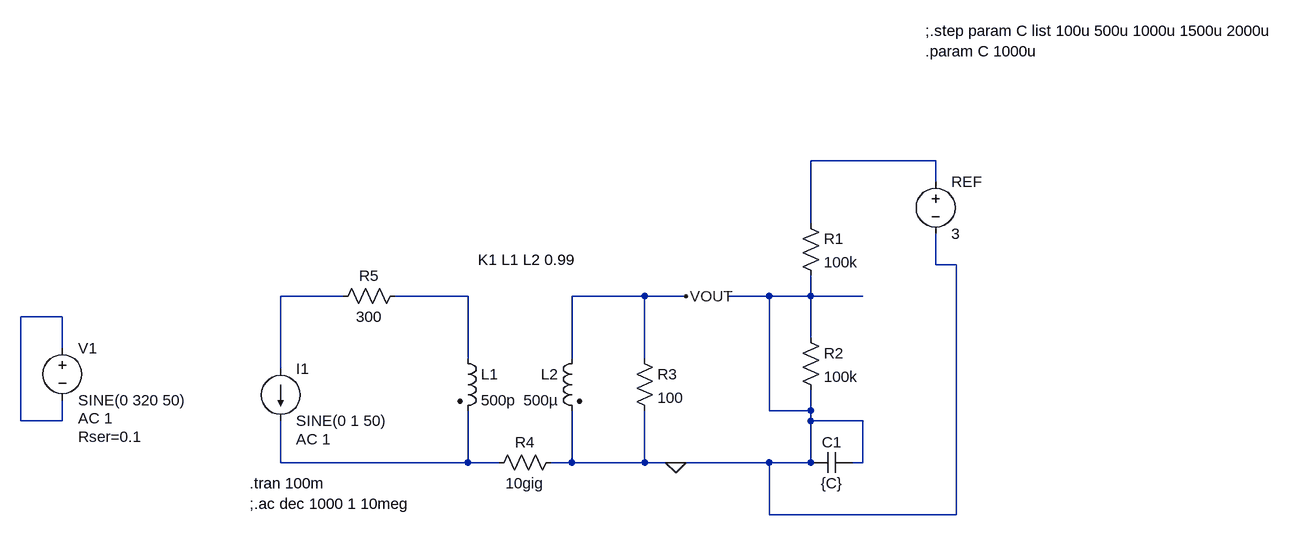
[diagram p0: schematic mains_measure_current.asc]
mains_measure_current.asc, the LTspice schematic file:
Version 4
SHEET 1 1512 680
WIRE 976 -176 784 -176
WIRE 976 -144 976 -176
WIRE 784 -80 784 -176
WIRE 976 -16 976 -64
WIRE 1008 -16 976 -16
WIRE 64 32 -32 32
WIRE 256 32 144 32
WIRE 528 32 416 32
WIRE 592 32 528 32
WIRE 720 32 656 32
WIRE 784 32 784 0
WIRE 784 32 720 32
WIRE 864 32 784 32
WIRE -368 64 -432 64
WIRE 784 96 784 32
WIRE -368 112 -368 64
WIRE 256 128 256 32
WIRE 416 128 416 32
WIRE 528 128 528 32
WIRE -32 144 -32 32
WIRE 720 208 720 32
WIRE 784 208 784 176
WIRE 784 208 720 208
WIRE -432 224 -432 64
WIRE -368 224 -368 192
WIRE -368 224 -432 224
WIRE 784 224 784 208
WIRE 864 224 784 224
WIRE -32 288 -32 224
WIRE 256 288 256 208
WIRE 256 288 -32 288
WIRE 304 288 256 288
WIRE 416 288 416 208
WIRE 416 288 384 288
WIRE 528 288 528 208
WIRE 528 288 416 288
WIRE 576 288 528 288
WIRE 720 288 576 288
WIRE 784 288 784 224
WIRE 784 288 720 288
WIRE 864 288 864 224
WIRE 864 288 848 288
WIRE 720 368 720 288
WIRE 1008 368 1008 -16
WIRE 1008 368 720 368
FLAG 576 288 0
FLAG 592 32 VOUT
SYMBOL voltage 976 -160 R0
WINDOW 123 0 0 Left 0
WINDOW 39 0 0 Left 0
SYMATTR InstName REF
SYMATTR Value 3
SYMBOL res 512 112 R0
SYMATTR InstName R3
SYMATTR Value 100
SYMBOL ind2 240 112 R0
SYMATTR InstName L1
SYMATTR Value 500p
SYMATTR Type ind
SYMATTR SpiceLine Rser=1p
SYMBOL current -32 144 R0
WINDOW 123 24 108 Left 2
WINDOW 39 0 0 Left 0
SYMATTR InstName I1
SYMATTR Value SINE(0 1 50)
SYMATTR Value2 AC 1
SYMBOL ind2 432 112 M0
SYMATTR InstName L2
SYMATTR Value 500µ
SYMATTR Type ind
SYMATTR SpiceLine Rser=1m
SYMBOL res 768 -96 R0
SYMATTR InstName R1
SYMATTR Value 100k
SYMBOL res 768 80 R0
SYMATTR InstName R2
SYMATTR Value 100k
SYMBOL cap 848 272 R90
WINDOW 0 0 32 VBottom 2
WINDOW 3 32 32 VTop 2
SYMATTR InstName C1
SYMATTR Value {C}
SYMBOL res 400 272 R90
WINDOW 0 0 56 VBottom 2
WINDOW 3 32 56 VTop 2
SYMATTR InstName R4
SYMATTR Value 10gig
SYMBOL res 160 16 R90
WINDOW 0 0 56 VBottom 2
WINDOW 3 32 56 VTop 2
SYMATTR InstName R5
SYMATTR Value 300
SYMBOL voltage -368 96 R0
WINDOW 123 24 124 Left 2
WINDOW 39 24 152 Left 2
SYMATTR InstName V1
SYMATTR Value SINE(0 320 50)
SYMATTR Value2 AC 1
SYMATTR SpiceLine Rser=0.1
TEXT -80 320 Left 2 !.tran 100m\n;.ac dec 1000 1 10meg
TEXT 960 -376 Left 2 !;.step param C list 100u 500u 1000u 1500u 2000u\n.param C 1000u
TEXT 272 -24 Left 2 !K1 L1 L2 0.99

The netlist it stands for:
* mains_measure_current.asc
V§REF N001 0 3
R3 VOUT 0 100
L1 N003 N005 500p Rser=1p
I1 N002 N005 SINE(0 1 50) AC 1
L2 VOUT 0 500µ Rser=1m
R1 N001 0 100k
R2 0 0 100k
C1 0 0 {C}
R4 0 N005 10gig
R5 N003 N002 300
V1 N004 N004 SINE(0 320 50) AC 1 Rser=0.1
.tran 100m
;.ac dec 1000 1 10meg
;.step param C list 100u 500u 1000u 1500u 2000u
.param C 1000u
K1 L1 L2 0.99
.backanno
.end